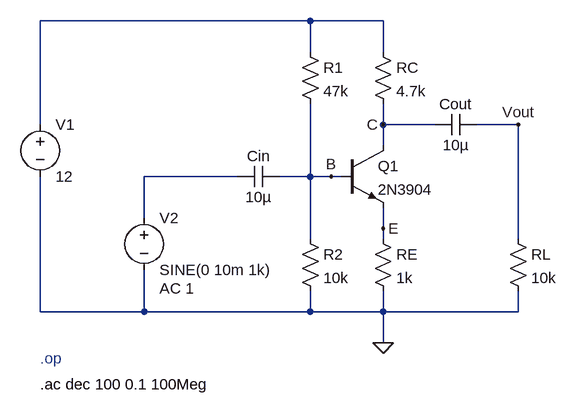
[diagram p0: schematic W02_D09_CommonEmitter_Amplifier.asc]
W02_D09_CommonEmitter_Amplifier.asc, the LTspice schematic file:
Version 4.1
SHEET 1 880 680
WIRE 48 -64 -368 -64
WIRE 160 -64 48 -64
WIRE 48 -16 48 -64
WIRE 160 -16 160 -64
WIRE -368 96 -368 -64
WIRE 160 96 160 64
WIRE 240 96 160 96
WIRE 368 96 304 96
WIRE 160 128 160 96
WIRE -64 176 -208 176
WIRE 48 176 48 64
WIRE 48 176 0 176
WIRE 80 176 48 176
WIRE 96 176 80 176
WIRE -208 240 -208 176
WIRE 160 256 160 224
WIRE 48 272 48 176
WIRE 160 272 160 256
WIRE 368 272 368 96
WIRE -368 384 -368 176
WIRE -208 384 -208 320
WIRE -208 384 -368 384
WIRE 48 384 48 352
WIRE 48 384 -208 384
WIRE 160 384 160 352
WIRE 160 384 48 384
WIRE 368 384 368 352
WIRE 368 384 160 384
WIRE 160 432 160 384
FLAG 80 176 B
FLAG 160 96 C
FLAG 160 256 E
FLAG 160 432 0
FLAG 368 96 Vout
SYMBOL npn 96 128 R0
SYMATTR InstName Q1
SYMATTR Value 2N3904
SYMBOL res 32 -32 R0
SYMATTR InstName R1
SYMATTR Value 47k
SYMBOL res 32 256 R0
SYMATTR InstName R2
SYMATTR Value 10k
SYMBOL res 144 -32 R0
SYMATTR InstName RC
SYMATTR Value 4.7k
SYMBOL res 144 256 R0
SYMATTR InstName RE
SYMATTR Value 1k
SYMBOL voltage -368 80 R0
SYMATTR InstName V1
SYMATTR Value 12
SYMBOL voltage -208 224 R0
WINDOW 123 24 124 Left 2
WINDOW 39 0 0 Left 0
SYMATTR InstName V2
SYMATTR Value SINE(0 10m 1k)
SYMATTR Value2 AC 1
SYMBOL cap 0 160 R90
WINDOW 0 0 32 VBottom 2
WINDOW 3 32 32 VTop 2
SYMATTR InstName Cin
SYMATTR Value 10µ
SYMBOL cap 304 80 R90
WINDOW 0 0 32 VBottom 2
WINDOW 3 32 32 VTop 2
SYMATTR InstName Cout
SYMATTR Value 10µ
SYMBOL res 352 256 R0
SYMATTR InstName RL
SYMATTR Value 10k
TEXT -368 456 Left 2 ;.op
TEXT -368 496 Left 2 !.ac dec 100 0.1 100Meg

The netlist it stands for:
* W02_D09_CommonEmitter_Amplifier.asc
Q1 C B E 0 2N3904
R1 N001 B 47k
R2 B 0 10k
RC N001 C 4.7k
RE E 0 1k
V1 N001 0 12
V2 N002 0 SINE(0 10m 1k) AC 1
Cin B N002 10µ
Cout Vout C 10µ
RL Vout 0 10k
.model NPN NPN
.model PNP PNP
.lib standard.bjt
* .op
.ac dec 100 0.1 100Meg
.backanno
.end